# EAGLE schematic Slave_Pedal_Schematic_rev1 (EAGLE 9.7.0)
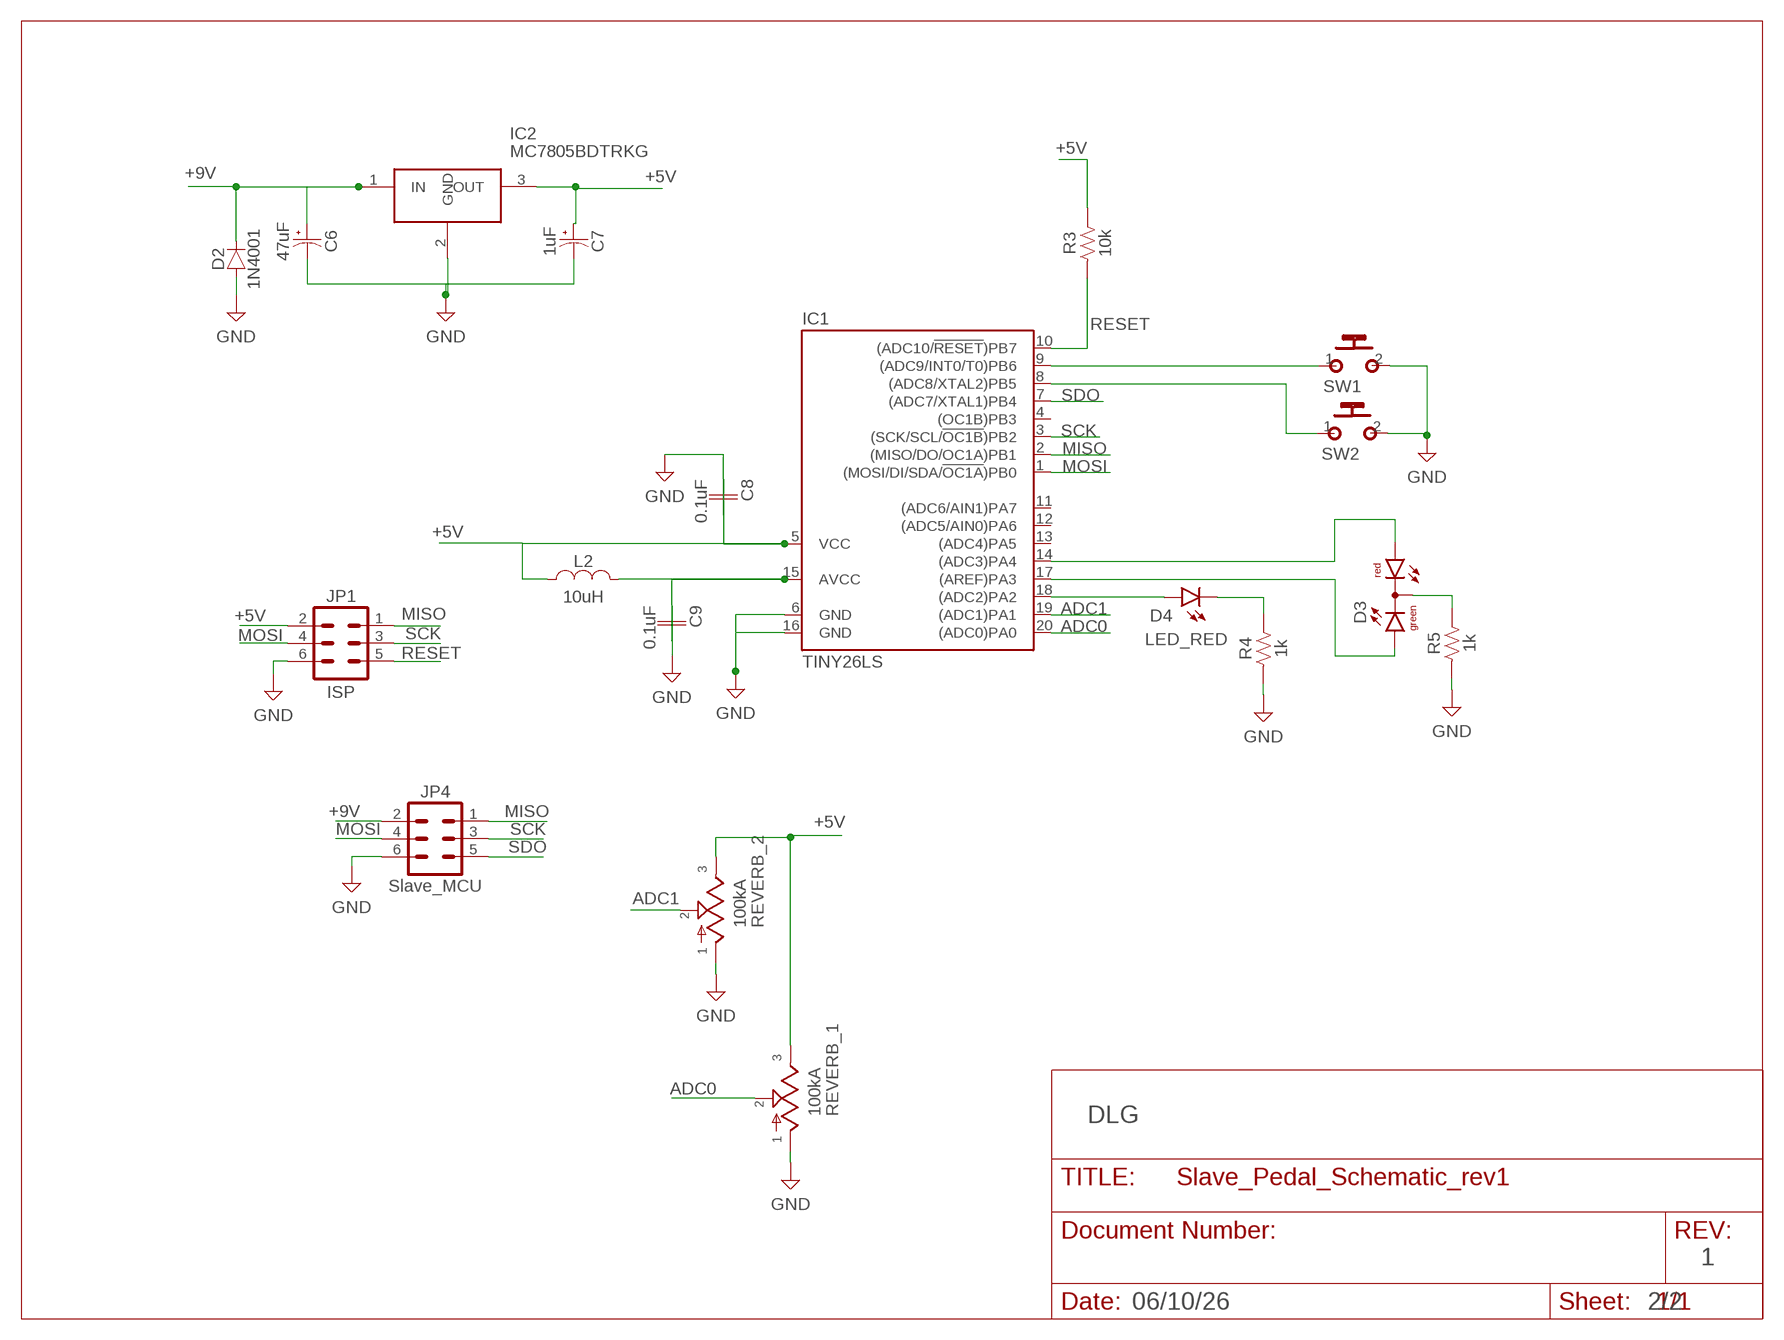
[diagram p0: schematic, sheet 1]
FRAME1 (LETTER_L): ARTHOR: DLG; DATE: 06/10/26; REV: 1; SHT: 2/2

## Parts
C6  47uF  C-POL-USECAP-4MM  [CAPAE430X430N]
C7  1uF  C-POL-USECAP-4MM  [CAPAE430X430N]
C8  0.1uF  C_CHIP-1206(3216-METRIC)  [CAPC3216X135]
C9  0.1uF  C_CHIP-1206(3216-METRIC)  [CAPC3216X135]
D2  1N4001  DIODE_ES1D_SMA  [DIOM5226X290N]
D3  DUOLED5MMRGLED_LIFTED  [DUOLED-C-5MM]
D4  LED_RED  LED_RADIALRED_6MM  [LEDRD254W60D565H860B]
IC1  TINY26LS  [SO20L]
IC2  MC7805BDTRKG  [LM317MADTRKG]
JP1  ISP  CONN_03X22MM_PITCH  [2X3-SHROUDED]
JP4  Slave_MCU  CONN_03X22MM_PITCH  [2X3-SHROUDED]
L2  10uH  L_CHIP-1206(3216-METRIC)  [INDC3216X190]
R3  10k  R-US_CHIP-1206(3216-METRIC)  [RESC3216X70]
R4  1k  R-US_CHIP-1206(3216-METRIC)  [RESC3216X70]
R5  1k  R-US_CHIP-1206(3216-METRIC)  [RESC3216X70]
REVERB_1  100kA  POT16MM  [16MM]
REVERB_2  100kA  POT16MM  [16MM]
SW1  MOMENTARYJST  [B2B-XH-A]
SW2  MOMENTARYJST  [B2B-XH-A]

## Nets
+5V [Power]: C7.1(+) C8.1 IC1.5(VCC) IC2.3(OUT) JP1.2 L2.1 R3.2 REVERB_1.3 REVERB_2.3
+9V [Power]: C6.1(+) D2.1(C) IC2.1(IN) JP4.2
ADC0: IC1.20((ADC0)PA0) REVERB_1.2
ADC1: IC1.19((ADC1)PA1) REVERB_2.2
GND: C6.2(-) C7.2(-) C8.2 C9.1 D2.2(A) IC1.6(GND) IC1.16(GND) IC2.2(GND) JP1.6 JP4.6 R4.1 R5.1 REVERB_1.1 REVERB_2.1 SW1.2(S) SW2.2(S)
MISO: IC1.2((MISO/DO/OC1A)PB1) JP1.1 JP4.1
MOSI: IC1.1((MOSI/DI/SDA/!OC1A!)PB0) JP1.4 JP4.4
N$1: IC1.9((ADC9/INT0/T0)PB6) SW1.1(P)
N$2: IC1.8((ADC8/XTAL2)PB5) SW2.1(P)
N$3: D3.AR IC1.14((ADC3)PA4)
N$4: D4.1(A) IC1.18((ADC2)PA2)
N$5: D3.AX(AG) IC1.17((AREF)PA3)
N$6: C9.2 IC1.15(AVCC) L2.2
N$7: D4.2(C) R4.2
N$8: D3.C R5.2
RESET: IC1.10((ADC10/!RESET!)PB7) JP1.5 R3.1
SCK: IC1.3((SCK/SCL/!OC1B!)PB2) JP1.3 JP4.3
SDO: IC1.7((ADC7/XTAL1)PB4) JP4.5
Unconnected: IC1.4((OC1B)PB3) IC1.11((ADC6/AIN1)PA7) IC1.12((ADC5/AIN0)PA6) IC1.13((ADC4)PA5)

## Library data of the parts
C6 C7 = Capacitor:C-POL-US: Capacitor Polarised - ANSI; CATEGORY_L1: Capacitor; CATEGORY_L2: Aluminum Electrolytic Capacitors; CATEGORY_L3: Radial Can; DESCRIPTION: ECAP (Aluminum Electrolytic Capacitor), 0.157" Dia (4.00mm) body Size, 0.217" (5.50mm) Height - Seated (Max), 0.169" L x 0.169" W (4.30mm x 4.30mm) Surface Mount Land Size; PACKAGE: Surface Mount
C8 C9 = Capacitor:C: Capacitor - Generic; CATEGORY_L1: Capacitor; CATEGORY_L2: Ceramic Capacitors; CATEGORY_L3: MLCC; PACKAGE: Surface Mount; PACKAGE_SIZE: 1206
D2 = Diode:DIODE_: Diode Rectifier - Popular Parts; CATEGORY_L1: Diodes; CATEGORY_L2: Rectifiers; CATEGORY_L3: Ultra Fast Recovery Rectifiers; DATASHEET: https://www.onsemi.com/download/data-sheet/pdf/es1d-d.pdf; DESCRIPTION: Diode 200 V 1A Surface Mount DO-214AC (SMA); FORWARD_CURRENT: 1A; FORWARD_VOLTAGE: 920mV; MANUFACTURER: onsemi; MPN: ES1D; OPERATING_TEMPERATURE: -55°C ~ 150°C; PACKAGE: Surface Mount; PART_STATUS: Active; REVERSE_VOLTAGE: 200V; ROHS: Compliant; SERIES: ES1D
D3 = led:DUOLED5MM: DUO LED 2 colors, 5 mm, round
D4 = Tinkercad:LED_RADIAL: LED - Generic; CATEGORY: Opto-Electronic; SUB-CATEGORY: LED
IC1 = atmel:TINY26*: 8-bit AVR Microcontroller with 2K Bytes Flash Source: http://www.atmel.com .. doc1477.pdf; MPN: ATTINY26L-8SU; OC_FARNELL: 9171665; OC_NEWARK: 01M6921
IC2 = MC7805BDTRKG:MC7805BDTRKG: Output Current in Excess of 1.0 A; No External Components Required; Internal Thermal Overload Protection; Internal Short Circuit Current Limiting; Output Transistor Safe-Area Compensation; Output Voltage Offered in 2% and 4% Tolerance; Pb-Free Packages are Available Source: Datasheet <https://www.onsemi.com/pub/Collateral/MC7800-D.PDF>; DESCRIPTION: Output Current in Excess of 1.0 A; No External Components Required; Internal Thermal Overload Protection; Internal Short Circuit Current Limiting; Output Transistor Safe-Area Compensation; Output Voltage Offered in 2% and 4% Tolerance; Pb-Free Packages are Available; HEIGHT: 2.38mm; MANUFACTURER_NAME: onsemi; MANUFACTURER_PART_NUMBER: MC7805BDTRKG; MOUSER_PART_NUMBER: 863-MC7805BDTRKG; MOUSER_PRICE-STOCK: https://www.mouser.co.uk/ProductDetail/onsemi/MC7805BDTRKG?qs=%252B9%2Fcbd0IE0RVSCV5SBH6%2FA%3D%3D
JP1 JP4 = SparkFun-Connectors:CONN_03X2: Multi connection point. Often used as Generic Header-pin footprint for 0.1 inch spaced/style header connections You can populate with any combo of single row headers, but if you'd like an exact match, check these: Header - 2x3 (Male, 0.1") <https://www.sparkfun.com/products/12807> (PRT-12807) Header - 2x3 (Female, 0.1") <https://www.sparkfun.com/products/13010> (PRT-13010) 2x3 Pin Shrouded Header <https://www.sparkfun.com/products/10877> (PRT-10877) On any of the 0.1 inch spaced packages, you can populate with these: Break Away Headers - Straight <https://www.sparkfun.com/products/116> (PRT-00116) Break Away Male Headers - Right Angle <https://www.sparkfun.com/products/553> (PRT-00553) Female Headers <https://www.sparkfun.com/products/115> (PRT-00115) Break Away Headers - Machine Pin <https://www.sparkfun.com/products/117> (PRT-00117) Break Away Female Headers - Swiss Machine Pin <https://www.sparkfun.com/products/743> (PRT-00743) Special note: the shrouded connector mates well with our 3x2 ribbon cables: Ribbon Crimp Connector - 6-pin (2x3, Female) <https://www.sparkfun.com/products/10651> (PRT-10651) Ribbon Cable - 6 wire (15ft) <https://www.sparkfun.com/products/10646> (PRT-10646); PROD_ID: CONN-14886
L2 = Inductor:L: Inductor Fixed - Generic; CATEGORY_L1: Inductors; DESCRIPTION: Chip 3.20 X 1.60 X 1.90 mm body 1206(3216-METRIC); PACKAGE: Surface Mount; PACKAGE_SIZE: 1206
R3-R5 = Resistor:R-US: Resistor Fixed - ANSI; CATEGORY_L1: Resistors; DESCRIPTION: Chip Resistor 3.20 X 1.60 X 0.70 mm body 1206(3216-METRIC) Package; PACKAGE: Surface Mount; PACKAGE_SIZE: 1206
REVERB_1 REVERB_2 = gm-pots:POT: Potentiometers the arrow indicates the clockwise motion of th wiper (lug 2) fully counter clockwise there is no resistance between lugs 1 and 2 fully clockwise the resistance between lugs 1 and 2 is the value of the pot
SW1 SW2 = gm-switches:MOMENTARY

## Net classes
1 Power: width 0.6 mm